# Altium schematic sheet OLED_LED_Connector.SchDoc
size A4; SheetNumber: 6; SheetTotal: 12
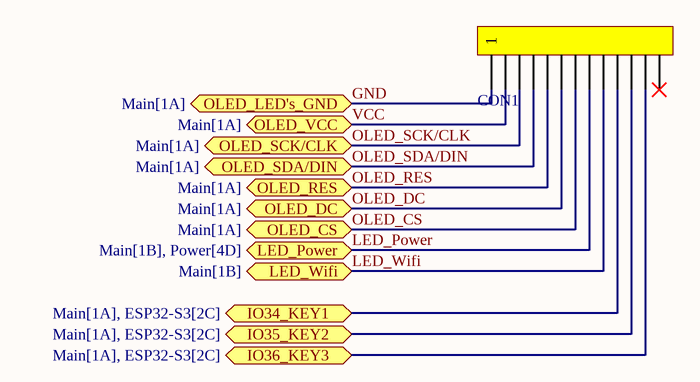
[diagram p0: OLED_LED_Connector.SchDoc]

## Parts
CON1  10 Pin  [Mini SPOX 5267 - 13Pin]  (value not drawn)

## Ports
IO34_KEY1 (bidir, see Main[1A], ESP32-S3[2C]), IO35_KEY2 (bidir, see Main[1A], ESP32-S3[2C]), IO36_KEY3 (bidir, see Main[1A], ESP32-S3[2C]), LED_Power (bidir, see Main[1B], Power[4D]), LED_Wifi (bidir, see Main[1B]), OLED_CS (bidir, see Main[1A]), OLED_DC (bidir, see Main[1A]), OLED_LED's_GND (bidir, see Main[1A]), OLED_RES (bidir, see Main[1A]), OLED_SCK/CLK (bidir, see Main[1A]), OLED_SDA/DIN (bidir, see Main[1A]), OLED_VCC (bidir, see Main[1A])

## Nets
GND: CON1.1 ; port OLED_LED's_GND
IO34_KEY1: CON1.10 ; port IO34_KEY1
IO35_KEY2: CON1.11 ; port IO35_KEY2
IO36_KEY3: CON1.12 ; port IO36_KEY3
LED_Power: CON1.8 ; port LED_Power
LED_Wifi: CON1.9 ; port LED_Wifi
OLED_CS: CON1.7 ; port OLED_CS
OLED_DC: CON1.6 ; port OLED_DC
OLED_RES: CON1.5 ; port OLED_RES
OLED_SCK/CLK: CON1.3 ; port OLED_SCK/CLK
OLED_SDA/DIN: CON1.4 ; port OLED_SDA/DIN
VCC: CON1.2 ; port OLED_VCC

Not connected (* = marked no-connect by the designer): CON1 13*

## Library data of the parts
CON1 = Mini-SPOX 5267- 13Pin: Mini SPOX 5267 Series / 10 Pin